# Altium schematic sheet 12_Camera.SchDoc
size 508 x 381 mm; SheetNumber: 12; SheetTotal: 16
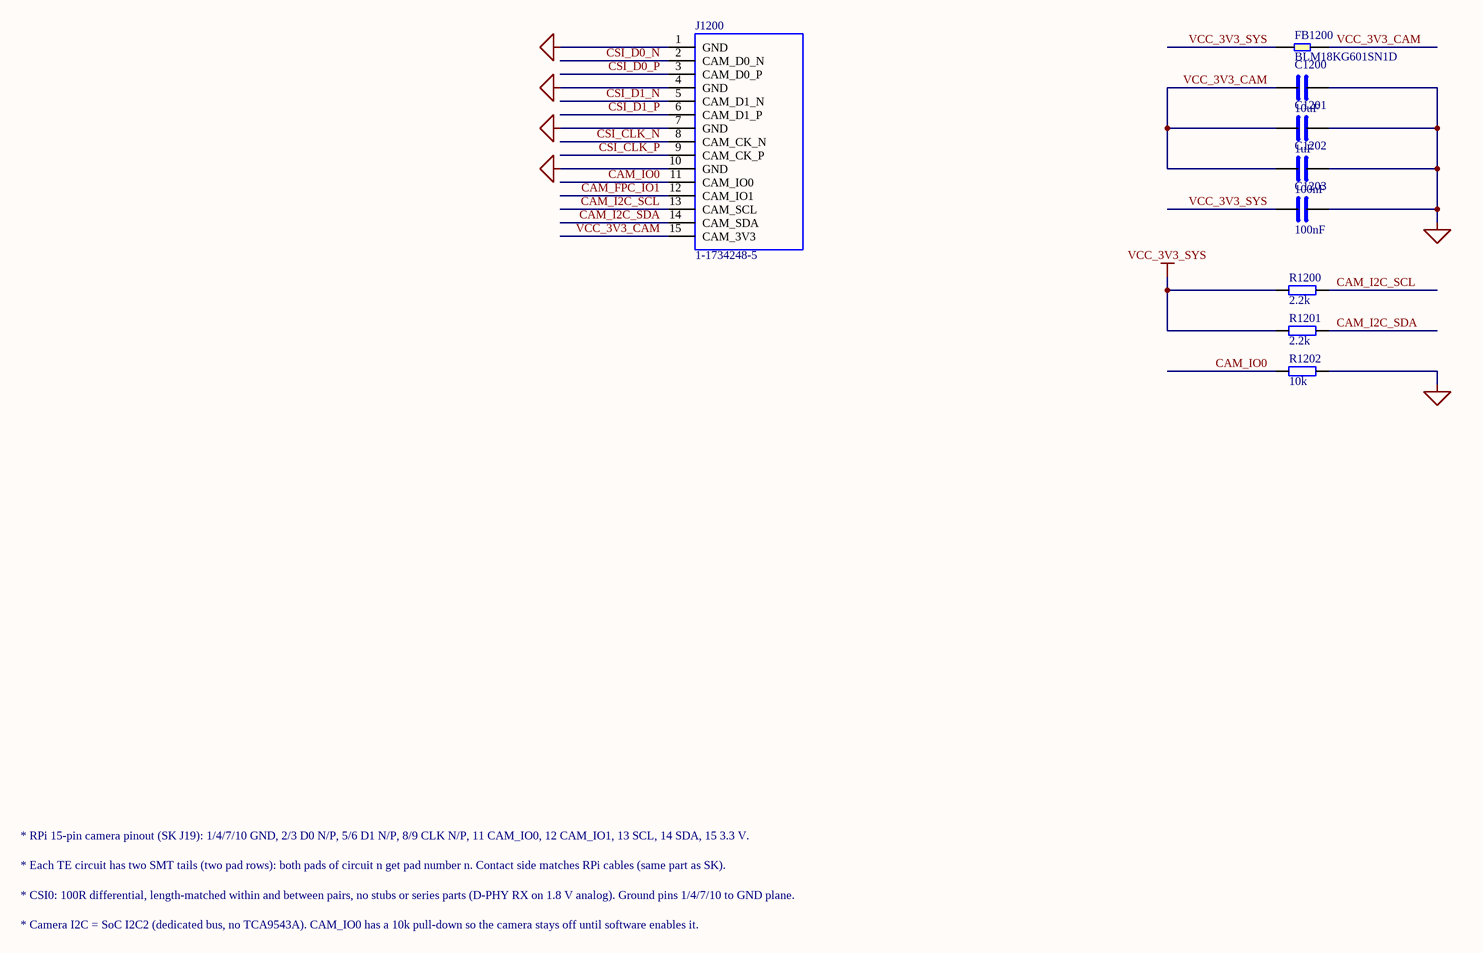
[diagram p0: 12_Camera.SchDoc]

## Parts
C1200  10uF  [C0603]
C1201  1uF  [C0402]
C1202  100nF  [C0402]
C1203  100nF  [C0402]
FB1200  BLM18KG601SN1D  [FB0603]
J1200  1-1734248-5  [FPC_TE_1-1734248-5]
R1200  2.2k  [R0402]
R1201  2.2k  [R0402]
R1202  10k  [R0402]

## Nets
GND: C1200.2 C1201.2 C1202.2 C1203.2 J1200.1(GND) J1200.4(GND) J1200.7(GND) J1200.10(GND) R1202.2
VCC_3V3_SYS: C1203.1 FB1200.1 R1200.1 R1201.1
CAM_FPC_IO1: J1200.12(CAM_IO1)
CAM_I2C_SCL: J1200.13(CAM_SCL) R1200.2
CAM_I2C_SDA: J1200.14(CAM_SDA) R1201.2
CAM_IO0: J1200.11(CAM_IO0) R1202.1
CSI_CLK_N: J1200.8(CAM_CK_N)
CSI_CLK_P: J1200.9(CAM_CK_P)
CSI_D0_N: J1200.2(CAM_D0_N)
CSI_D0_P: J1200.3(CAM_D0_P)
CSI_D1_N: J1200.5(CAM_D1_N)
CSI_D1_P: J1200.6(CAM_D1_P)
VCC_3V3_CAM: C1200.1 C1201.1 C1202.1 FB1200.2 J1200.15(CAM_3V3)

## Notes on the sheet
- * RPi 15-pin camera pinout (SK J19): 1/4/7/10 GND, 2/3 D0 N/P, 5/6 D1 N/P, 8/9 CLK N/P, 11 CAM_IO0, 12 CAM_IO1, 13 SCL, 14 SDA, 15 3.3 V.
- * Each TE circuit has two SMT tails (two pad rows): both pads of circuit n get pad number n. Contact side matches RPi cables (same part as SK).
- * CSI0: 100R differential, length-matched within and between pairs, no stubs or series parts (D-PHY RX on 1.8 V analog). Ground pins 1/4/7/10 to GND plane.
- * Camera I2C = SoC I2C2 (dedicated bus, no TCA9543A). CAM_IO0 has a 10k pull-down so the camera stays off until software enables it.

## Library data of the parts
C1200 = CAP: Capacitor, non-polarized; Spec: 10uF 10V X5R 0603 (bulk at J1200, SK C43)
C1201 = CAP: Capacitor, non-polarized; Spec: 1uF 16V X5R 0402
C1202 = CAP: Capacitor, non-polarized; Spec: 100nF 16V X7R 0402 (at pin 15, SK C45)
C1203 = CAP: Capacitor, non-polarized; Spec: 100nF 16V X7R 0402 (bead input)
FB1200 = FERRITE: Ferrite bead; Manufacturer: Murata; Spec: BLM18KG601SN1D 600R@100MHz 1.3A 0603 (camera 3.3 V); MPN: BLM18KG601SN1D
J1200 = FPC15_RPI_CSI: 15-pin 1.0 mm FPC, Raspberry Pi camera pinout (TE 1-1734248-5); Manufacturer: TE Connectivity; MPN: 1-1734248-5
R1200 R1201 = RES: Resistor; Spec: 2.2k 0402 (I2C2 pull-up)
R1202 = RES: Resistor; Spec: 10k 0402 (camera off in reset)